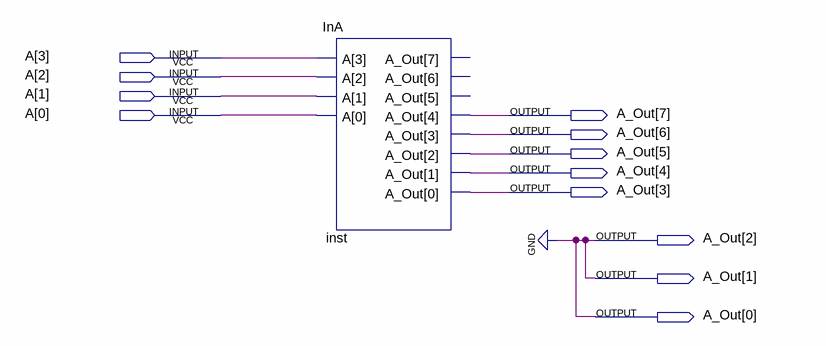
[diagram p0: schematic sheet]
// Quartus schematic shift_left_3.bdf as structural Verilog: 1 symbols, 12 pins
module shift_left_3 (
  input  [3:0] A,
  output [7:0] A_Out
);
  wire [7:0] inst_a_out_open;  // unused outputs

  InA inst (.A(A), .A_Out({inst_a_out_open[7:5], A_Out[7:3]}));

  assign A_Out[2:0] = 3'b000;
endmodule
